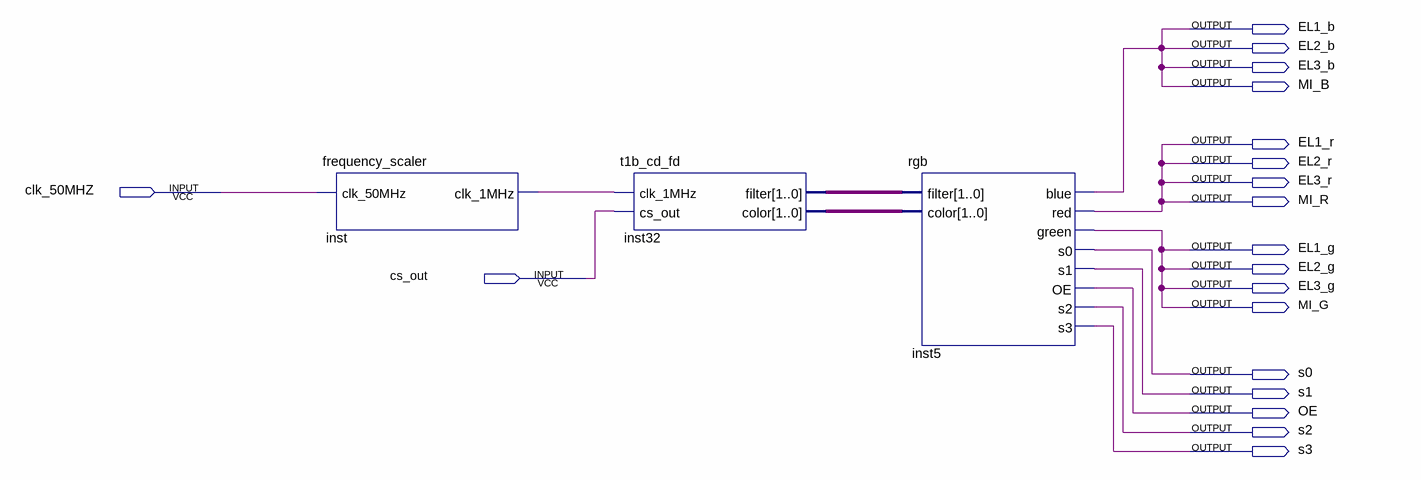
[diagram p0: schematic sheet]
// Quartus schematic color_sensor.bdf as structural Verilog: 3 symbols, 19 pins
module color_sensor (
  input  clk_50MHZ,
  input  cs_out,
  output EL1_b,
  output EL2_b,
  output EL3_b,
  output MI_B,
  output EL1_r,
  output EL2_r,
  output EL3_r,
  output MI_R,
  output EL1_g,
  output EL2_g,
  output EL3_g,
  output MI_G,
  output s0,
  output s1,
  output OE,
  output s2,
  output s3
);

  wire inst_clk_1mhz;
  wire [1:0] inst32_color, inst32_filter;

  frequency_scaler inst (.clk_50MHz(clk_50MHZ), .clk_1MHz(inst_clk_1mhz));
  t1b_cd_fd inst32 (.clk_1MHz(inst_clk_1mhz), .cs_out(cs_out), .filter(inst32_filter), .color(inst32_color));
  rgb inst5 (
    .filter(inst32_filter), .color(inst32_color), .blue(EL1_b), .red(EL1_r), .green(EL1_g), .s0(s0), .s1(s1),
    .OE(OE), .s2(s2), .s3(s3));

  assign EL2_b = EL1_b;
  assign EL2_g = EL1_g;
  assign EL2_r = EL1_r;
  assign EL3_b = EL1_b;
  assign EL3_g = EL1_g;
  assign EL3_r = EL1_r;
  assign MI_B = EL1_b;
  assign MI_G = EL1_g;
  assign MI_R = EL1_r;
endmodule
